# EAGLE design DuressBadge (EAGLE 9.6.2)
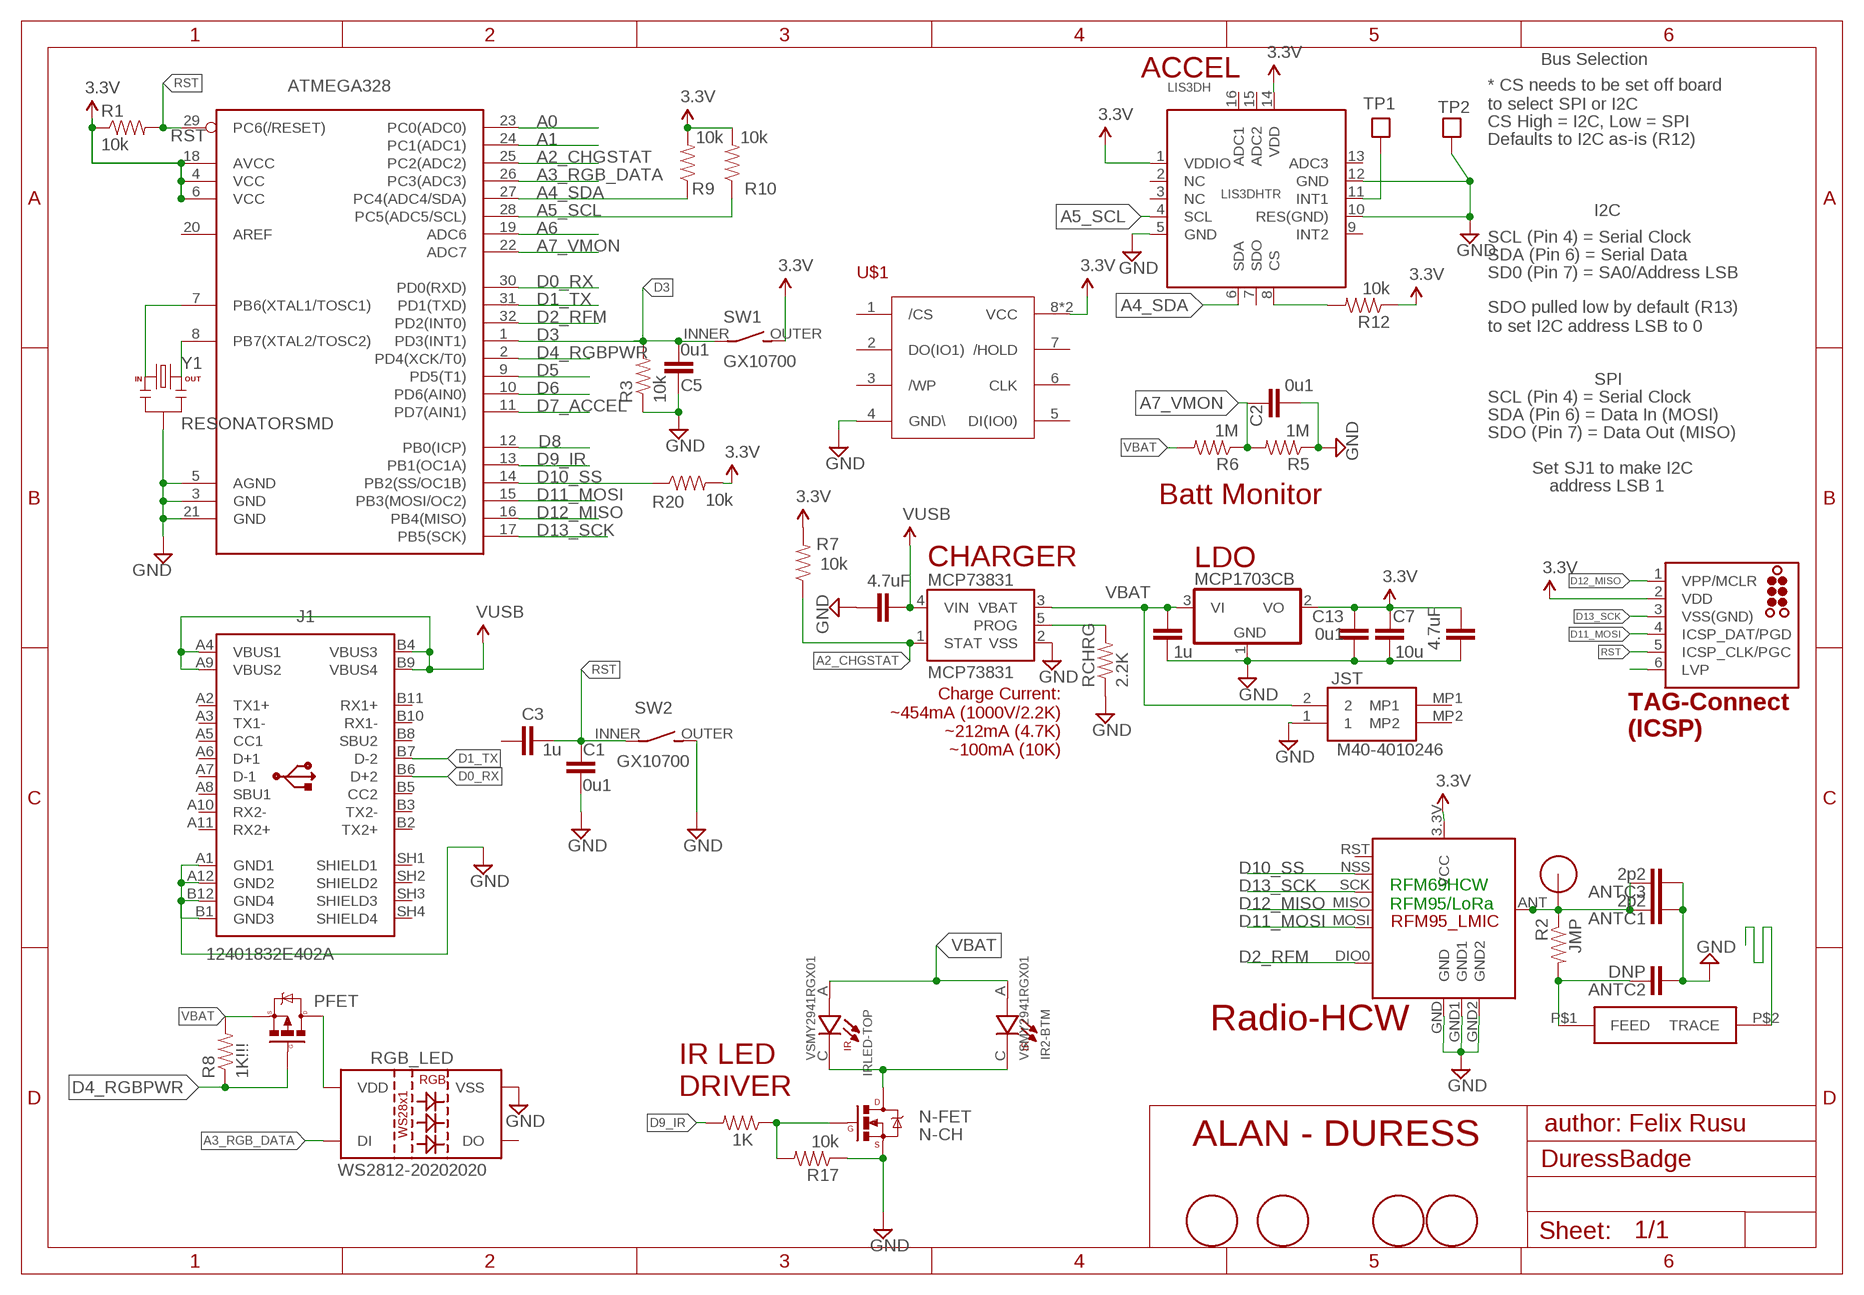
[diagram p0: schematic, sheet 1]

## Parts
ANTC1  2p2  CAP0603-CAP  [0603-CAP]
ANTC2  DNP  CAP0402-CAP  [0402-CAP]
ANTC3  2p2  CAP0402-CAP  [0402-CAP]
ATMEGA328  ATMega-328  ATMEGA168/328TQFP32  [TQFP32-08]
BR_FIDUCIAL  FIDUCIAL1.5MM  [FIDUCIAL_1.5MM]
C1  0u1  CAP0603-CAP  [0603-CAP]
C2  0u1  CAP0603-CAP  [0603-CAP]
C3  1u  CAP0603-CAP  [0603-CAP]
C4  4.7uF  CAP0603-CAP  [0603-CAP]
C5  0u1  CAP0603-CAP  [0603-CAP]
C7  10u  CAP0805-CAP  [0805-CAP]
C8  4.7uF  CAP0603-CAP  [0603-CAP]
C13  0u1  CAP0603-CAP  [0603-CAP]
C14  1u  CAP0603-CAP  [0603-CAP]
FIDUCIAL_BOTTOMRIGHT  FIDUCIALSQ  [FIDUCIAL_1.5MM_SQ]
FIDUCIAL_TOPLEFT  FIDUCIALSQ  [FIDUCIAL_1.5MM_SQ]
IR2-BTM  VSMY2941RGX01  [DIO_VSMY2941RGX01]
IRLED-TOP  VSMY2941RGX01  [DIO_VSMY2941RGX01]
J1  12401832E402A  [12401832E402A]
JST  M40-4010246  [M404010246]
LDO  MCP1703CB  [SOT23]
LIS3DH  LIS3DHTR  ACCEL_LIS3DHTR  [LGA16_3X3MM]
MCP73831  MCP73831  [SOT23-5]
N-FET  N-CH  MOSFET-NCHANNEL  [SOT23-3]
PFET  MOSFET-PCHANNELSMD  [SOT23-3]
R1  10k  RESISTOR0603-RES  [0603-RES]
R2  JMP  RESISTOR0402-RES  [0402-RES]
R3  10k  RESISTOR0603-RES  [0603-RES]
R4  1K  RESISTOR0603-RES  [0603-RES]
R5  1M  RESISTOR0603-RES  [0603-RES]
R6  1M  RESISTOR0603-RES  [0603-RES]
R7  10k  RESISTOR0603-RES  [0603-RES]
R8  1K!!!  RESISTOR0603-RES  [0603-RES]
R9  10k  RESISTOR0603-RES  [0603-RES]
R10  10k  RESISTOR0603-RES  [0603-RES]
R12  10k  RESISTOR0603-RES  [0603-RES]
R17  10k  RESISTOR0603-RES  [0603-RES]
R20  10k  RESISTOR0603-RES  [0603-RES]
RCHRG  2.2K  RESISTOR0603-RES  [0603-RES]
RGB_LED  WS2812-20202020  [WS2812-2020]
SW1  GX10700  [GX10700]
SW2  GX10700  [GX10700]
TAG-ICSP  TAG-Connect  TC2030_ICSP-MCP-NL  [TC2030-MCP-NL]
TL_FIDUCIAL  FIDUCIAL1.5MM  [FIDUCIAL_1.5MM]
TP1  PAD_OR_PIN_1TP  [PAD_1_TESTPOINT]
TP2  PAD_OR_PIN_1TP  [PAD_1_TESTPOINT]
U$1  RFM12B_ANTENNA  [ANTENNA_THRUHOLE]
U$2  W25Q40CLSNIG  [USON]
U$5  JOHANSON0900AT43A0070  [JOHANSON0900AT43A0070]
U$11  RFM95_WITHRST  [RFM95_LONGER_WITHRST]
Y1  RESONATORSMD  [RESONATOR-SMD]

## Nets
A0: ATMEGA328.23(PC0(ADC0))
A1: ATMEGA328.24(PC1(ADC1))
A2_CHGSTAT: ATMEGA328.25(PC2(ADC2)) MCP73831.1(STAT) R7.1
A3_RGB_DATA: ATMEGA328.26(PC3(ADC3)) RGB_LED.3(DI)
A4_SDA: ATMEGA328.27(PC4(ADC4/SDA)) LIS3DH.6(SDA) R9.1
A5_SCL: ATMEGA328.28(PC5(ADC5/SCL)) LIS3DH.4(SCL) R10.1
A6: ATMEGA328.19(ADC6)
A7_VMON: ATMEGA328.22(ADC7) C2.1 R5.2 R6.1
ANT: ANTC1.2 ANTC3.2 R2.1 U$1.P$1 U$11.ANT
D0_RX: ATMEGA328.30(PD0(RXD)) J1.B6(D+2)
D1_TX: ATMEGA328.31(PD1(TXD)) J1.B7(D-2)
D2_RFM: ATMEGA328.32(PD2(INT0)) U$11.DIO0
D3: ATMEGA328.1(PD3(INT1)) C5.2 R3.2 SW1.INNER(P)
D4_RGBPWR: ATMEGA328.2(PD4(XCK/T0)) PFET.1(G) R8.1
D5: ATMEGA328.9(PD5(T1))
D6: ATMEGA328.10(PD6(AIN0))
D7_ACCEL: ATMEGA328.11(PD7(AIN1)) LIS3DH.11(INT1) TP1.TP
D8: ATMEGA328.12(PB0(ICP))
D9_IR: ATMEGA328.13(PB1(OC1A)) R4.2
D10_SS: ATMEGA328.14(PB2(SS/OC1B)) R20.1 U$11.NSS(SEL)
D11_MOSI: ATMEGA328.15(PB3(MOSI/OC2)) TAG-ICSP.4(ICSP_DAT/PGD) U$11.MOSI
D12_MISO: ATMEGA328.16(PB4(MISO)) TAG-ICSP.1(VPP/MCLR) U$11.MISO
D13_SCK: ATMEGA328.17(PB5(SCK)) TAG-ICSP.3(VSS(GND)) U$11.SCK
GND [power]: ANTC1.1 ANTC2.1 ANTC3.1 ATMEGA328.3(GND) ATMEGA328.5(AGND) ATMEGA328.21(GND) C1.1 C2.2 C4.1 C5.1 C7.2 C8.1 C13.2 C14.2 J1.A1(GND1) J1.A12(GND2) J1.B1(GND3) J1.B12(GND4) JST.1 LDO.1(GND) LIS3DH.5(GND) LIS3DH.10(RES(GND)) LIS3DH.12(GND) MCP73831.2(VSS) N-FET.2(S) R3.1 R5.1 R17.1 RCHRG.1 RGB_LED.2(VSS) SW2.OUTER(S) TAG-ICSP.6(LVP) TP2.TP U$2.4(GND\) U$11.GND U$11.GND1 U$11.GND2 Y1.XTAL2_GND
N$1: ATMEGA328.7(PB6(XTAL1/TOSC1)) Y1.XTAL1_IN
N$2: IR2-BTM.C IRLED-TOP.C N-FET.3(D)
N$3: MCP73831.5(PROG) RCHRG.2
N$4: U$5.P$2(TRACE)
N$5: PFET.3(D) RGB_LED.4(VDD)
N$6: N-FET.1(G) R4.1 R17.2
N$10: ANTC2.2 R2.2 U$5.P$1(FEED)
N$11: LIS3DH.8(CS) R12.2
N$21: ATMEGA328.8(PB7(XTAL2/TOSC2)) Y1.XTAL3_OUTPUT(XTAL3_OUT)
RST: ATMEGA328.29(PC6(/RESET)) C1.2 C3.2 R1.2 SW2.INNER(P) TAG-ICSP.5(ICSP_CLK/PGC)
VBAT: C14.1 IR2-BTM.A IRLED-TOP.A JST.2 LDO.3(VI) MCP73831.3(VBAT) PFET.2(S) R6.2 R8.2
VCC: ATMEGA328.4(VCC) ATMEGA328.6(VCC) ATMEGA328.18(AVCC) C4.2 C7.1 C13.1 LDO.2(VO) LIS3DH.1(VDDIO) LIS3DH.14(VDD) R1.1 R7.2 R9.2 R10.2 R12.1 R20.2 SW1.OUTER(S) TAG-ICSP.2(VDD) U$2.8(VCC) U$2.GND1(VCC) U$11.3.3V(VCC) ; supply symbol labelled 3.3V
VUSB: C8.2 J1.A4(VBUS1) J1.A9(VBUS2) J1.B4(VBUS3) J1.B9(VBUS4) MCP73831.4(VIN)
Unconnected: ATMEGA328.20(AREF) BR_FIDUCIAL.P$1(FIDUCIAL) C3.1 FIDUCIAL_BOTTOMRIGHT.P$1(FIDUCIAL) FIDUCIAL_TOPLEFT.P$1(FIDUCIAL) J1.A2(TX1+) J1.A3(TX1-) J1.A5(CC1) J1.A6(D+1) J1.A7(D-1) J1.A8(SBU1) J1.A10(RX2-) J1.A11(RX2+) J1.B2(TX2+) J1.B3(TX2-) J1.B5(CC2) J1.B8(SBU2) J1.B10(RX1-) J1.B11(RX1+) J1.SH1(SHIELD1) J1.SH2(SHIELD2) J1.SH3(SHIELD3) J1.SH4(SHIELD4) JST.MP1 JST.MP2 LIS3DH.2(NC) LIS3DH.3(NC) LIS3DH.7(SDO) LIS3DH.9(INT2) LIS3DH.13(ADC3) LIS3DH.15(ADC2) LIS3DH.16(ADC1) RGB_LED.1(DO) TL_FIDUCIAL.P$1(FIDUCIAL) U$2.1(/CS) U$2.2(DO(IO1)) U$2.3(/WP) U$2.5(DI(IO0)) U$2.6(CLK) U$2.7(/HOLD) U$11.RST

## Notes on the sheet
- ACCEL
- Bus Selection
- * CS needs to be set off board
  to select SPI or I2C
- CS High = I2C, Low = SPI
- Defaults to I2C as-is (R12)
- I2C
- SCL (Pin 4) = Serial Clock
- SDA (Pin 6) = Serial Data
- SD0 (Pin 7) = SA0/Address LSB
- SDO pulled low by default (R13)
  to set I2C address LSB to 0
- SPI
- SCL (Pin 4) = Serial Clock
- SDA (Pin 6) = Data In (MOSI)
- SDO (Pin 7) = Data Out (MISO)
- Set SJ1 to make I2C
- Batt Monitor
- address LSB 1
- CHARGER
- Charge Current:
  ~454mA (1000V/2.2K)
  ~212mA (4.7K)
  ~100mA (10K)
- TAG-Connect
  (ICSP)
- RFM69HCW
  RFM95/LoRa
- Radio-HCW
- IR LED
  DRIVER
- author: Felix Rusu
- ALAN - DURESS

## Library data of the parts
ANTC1-ANTC3 C1-C5 C7 C8 C13 C14 = LowPowerLab:CAP: Capacitor Standard 0603 ceramic capacitor, and 0.1" leaded capacitor.
ATMEGA328 = LowPowerLab:ATMEGA168/328: Atmel 32-pin 8-bit micro, 16k flash.
BR_FIDUCIAL FIDUCIAL_BOTTOMRIGHT FIDUCIAL_TOPLEFT TL_FIDUCIAL = LowPowerLab:FIDUCIAL
IR2-BTM IRLED-TOP = VSMY2941RGX01:VSMY2941RGX01: Infrared Emitters - High Power IR Emtr 940nm; 5ns 160mW/sr; rev-gwing Check availability <https://pricing.snapeda.com/parts/VSMY2941RGX01/Vishay%20Semiconductor/view-part?ref=eda>; AVAILABILITY: In Stock; CHECK_PRICES: https://www.snapeda.com/parts/VSMY2941RGX01/Vishay+Semiconductor+Opto+Division/view-part/?ref=eda; DESCRIPTION: IR Emitter: 940nm, SMD, 160mW/sr, +/-8degrees; MF: Vishay Semiconductor; MP: VSMY2941RGX01; PACKAGE: SMD-2 Vishay Semiconductor; PRICE: None; PURCHASE-URL: https://www.snapeda.com/api/url_track_click_mouser/?unipart_id=3622774&manufacturer=Vishay Semiconductor&part_name=VSMY2941RGX01&search_term=None; SNAPEDA_LINK: https://www.snapeda.com/parts/VSMY2941RGX01/Vishay+Semiconductor+Opto+Division/view-part/?ref=snap
J1 = Connector_USB:12401832E402A: USB(3.1) Type-C- RCPT- 24POS- SMD-THT-R/A Datasheet <https://cdn.amphenol-icc.com/media/wysiwyg/files/documentation/datasheet/inputoutput/io_usb_type_c.pdf> Drawing <https://cdn.amphenol-icc.com/media/wysiwyg/files/drawing/c12401832e402a.pdf>; CATEGORY: USB Connector; CONTACTS: 24; CURRENT_RATING: 5A; DATASHEET: https://cdn.amphenol-cs.com/media/wysiwyg/files/documentation/datasheet/inputoutput/io_usb_3_2_type_c.pdf; DESCRIPTION: USB-C (USB TYPE-C) USB 3.2 Gen 2 (USB 3.1 Gen 2- Superspeed + (USB 3.1)) Receptacle Connector 24 Position Surface Mount- Right Angle- Through Hole; GENDER: Receptacle; MANUFACTURER: Amphenol ICC (Commercial Products); MPN: 12401832E402A; OPERATING_TEMPERATURE: -40℃ ~ 85℃; PACKAGE_SIZE: NA; PACKAGE_TYPE: SMD; PART_STATUS: ACTIVE; ROHS: COMPLIANT; SERIES: NA; SUBCATEGORY: USB TYPE-C; TYPE: Surface Mount-Right Angle-Through Hole; VOLTAGE_RATING: NA
JST = M40-4010246:M40-4010246: Headers & Wire Housings 2P SIL SMT HORIZ SHROUDED TAB HEADER Source: Datasheet <https://componentsearchengine.com/Datasheets/2/M40-4010246.pdf>; DESCRIPTION: Headers & Wire Housings 2P SIL SMT HORIZ SHROUDED TAB HEADER; HEIGHT: 3.15mm; MANUFACTURER_NAME: Harwin; MANUFACTURER_PART_NUMBER: M40-4010246; MOUSER_PART_NUMBER: 855-M40-4010246; MOUSER_PRICE-STOCK: https://www.mouser.co.uk/ProductDetail/Harwin/M40-4010246?qs=%252Bk6%2F5FB6qrkoTdPFThSz5A%3D%3D
LDO = linear:MCP1703: 250 mA, 16V, Low Quiescent Current LDO Regulator Source: http://ww1.microchip.com/downloads/en/DeviceDoc/22049b.pdf
LIS3DH = microbuilder:ACCEL_LIS3DHTR: LIS3DHTR 3-Axis Accelerometer with I2C/SPI Interface VDD: 1.71-3.6V VDDIO: 1.71-VDD+0.1V Scale: +/-2g, 4g, 8g, 16g with 16--bit data output Temp:: -40°C - 85°C Mouser: 511-LIS3DHTR Digikey: 497-10613-1-ND
MCP73831 = SparkFun-PowerIC:MCP73831: Miniature single cell, fully integrated Li-Ion, Li-polymer charge management controller http://ww1.microchip.com/downloads/en/DeviceDoc/20001984g.pdf IC-09995; PROD_ID: IC-09995
N-FET = LowPowerLab:MOSFET-NCHANNEL: Generic PMOSFET
PFET = LowPowerLab:MOSFET-PCHANNEL: Generic PMOSFET
R1-R10 R12 R17 R20 RCHRG = LowPowerLab:RESISTOR: Resistor Basic schematic elements and footprints for 0603, 1206, and PTH resistors.
RGB_LED = LowPowerLab:WS2812-2020
SW1 SW2 = snaptron_Alan:GX10700
TAG-ICSP = tag-connect:TC2030_ICSP: TAG-CONNECT ICSP Connector Manufacturer: Tag-Connect <http://www.tag-connect.com> Cable for easy In-Circuit Serial Programming. Designed for Microchip ICD2, suitable for many others. Two variants - one "with legs" (for hands-free fit on PCB) and another "without legs" for quick programming. PAD Description 1 MCLR/Vpp 2 Vdd 3 GND 4 PGD (ISPDAT) 5 PGC (ISPCLK) 6 nc (used for LVP) ©2009 ROFA.cz - modified and updated by Robert Darlington ‹rdarlington@gmail.com›
TP1 TP2 = LowPowerLab:PAD_OR_PIN_1
U$1 = LowPowerLab:RFM12B_ANTENNA
U$2 = W25Q40CLSNIG:W25Q40CLSNIG: 2.5/3/3.3V 4M-BITSERIAL FLASH MEMORY WITH 4KB SECTORS, DUALAND QUADSPI
U$5 = Kris:JOHANSON0900AT43A0070: Johanson dual wide band antenna http://www.mouser.com/new/Johanson/johanson-0900at43a0070/
U$11 = LowPowerLab:RFM95_WITHRST
Y1 = LowPowerLab:RESONATOR: Resonator Small SMD resonator. This is the itty bitty 10/20MHz resonators with built in caps. CSTCE10M0G55 and CSTCE20M0V53. Footprint has been reviewed closely but hasn't been tested yet.

## Net classes
1 power: width 0.381 mm, clearance 0.254 mm

## Board
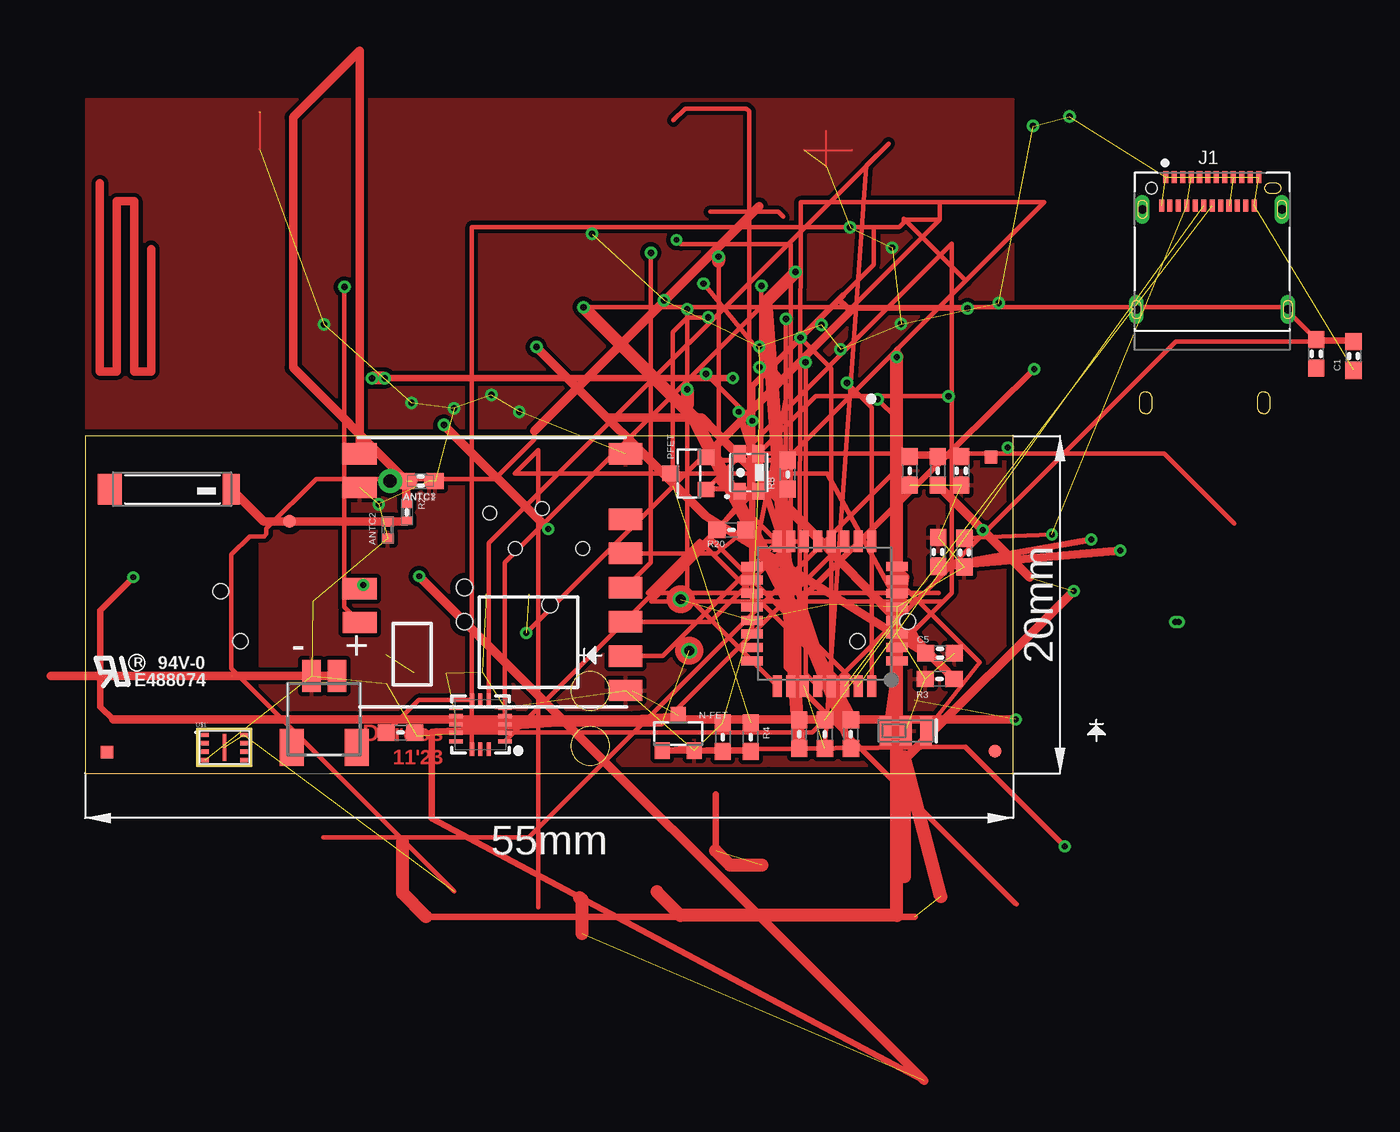
[diagram p1: board, top side]
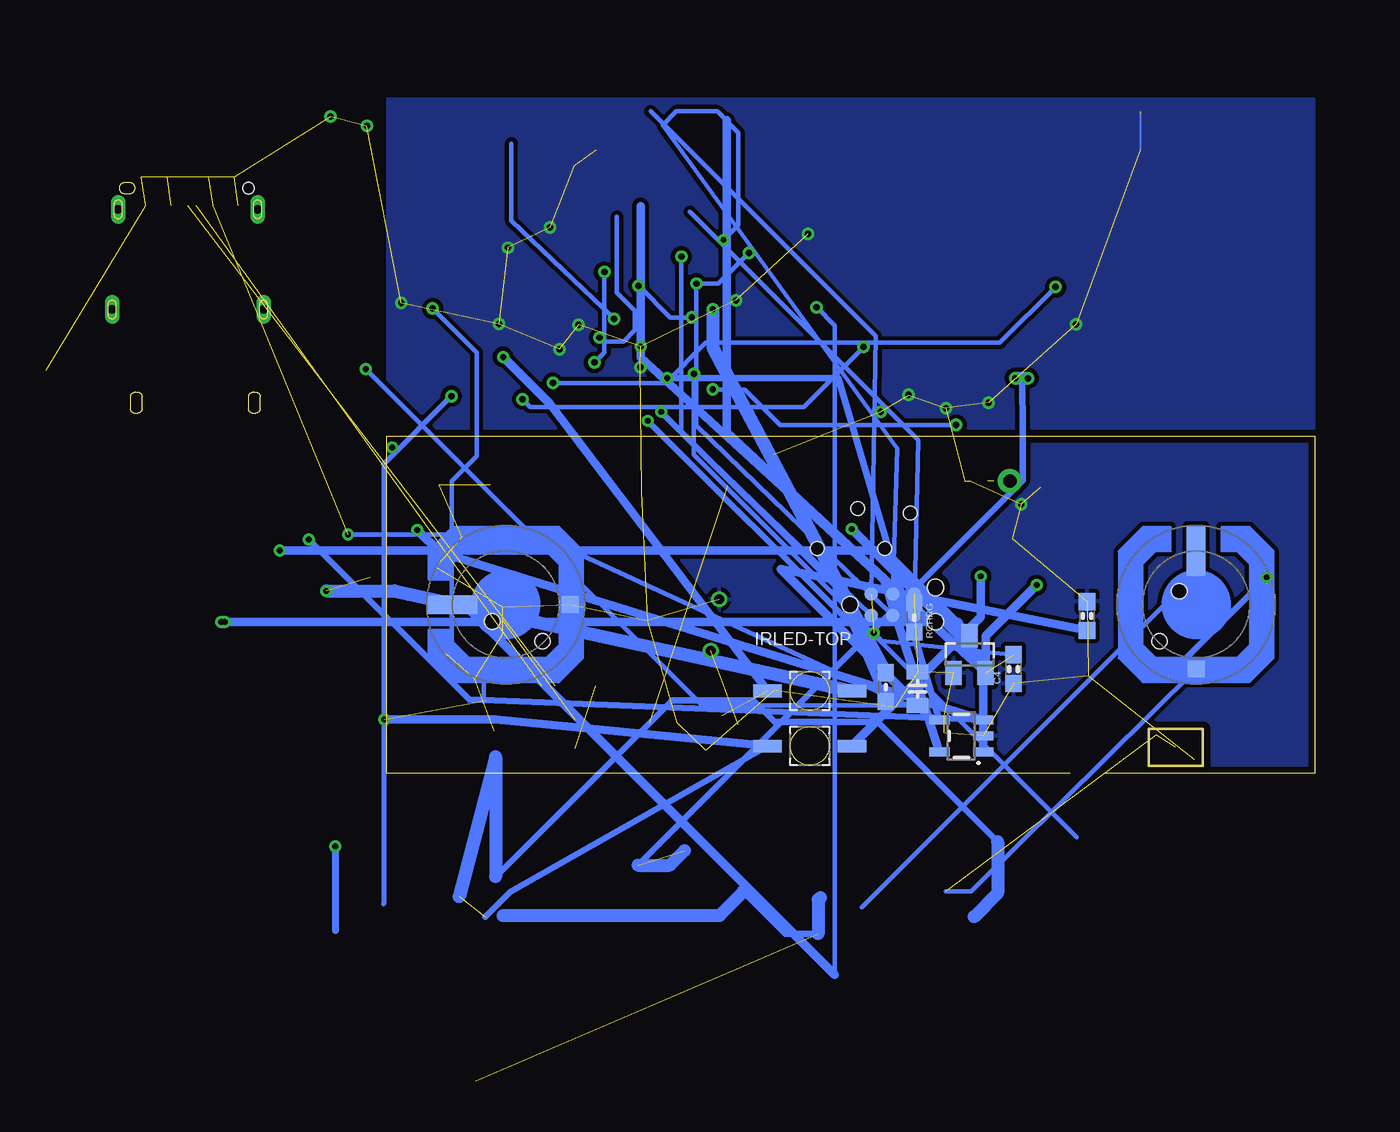
[diagram p2: board, bottom side, seen from below]

Size 70.21 x 22.61 mm. Coordinates in mm from the lower left corner, seen from the top.
Outline: 12.5,0 0,0 0,20 55,20
Outline: 14.5,0 40.5,0
Outline: 40.51,0 55,0 55,20
Outline: 62.51,21.59 62.51,22.35 arc-99 62.91,22.6 62.94,22.6 arc-70 63.2,22.37 63.21,22.35 63.21,21.59 arc-99 62.8,21.34 62.78,21.34 arc-75 62.51,21.59
Outline: 69.51,21.59 69.51,22.35 arc-99 69.91,22.6 69.94,22.6 arc-70 70.2,22.37 70.21,22.35 70.21,21.59 arc-99 69.81,21.34 69.78,21.34 arc-75 69.51,21.59
Copper layers (1*16): Top 0.035mm / dielectric 0.93mm / Bottom 0.035mm
Design rules "default *": minimum track width 6mil, minimum drill 13mil, track to track 8mil, track to pad 8mil, pad to pad 6mil, via to via 6mil, smd to smd 0mil, copper to edge 15mil, drill to drill 6mil, minimum pad ring 7mil, minimum via ring 7mil, stop-mask expansion 4mil, vias tented up to drill 28mil, thermal gap 10mil
Holes 0.8 mm at 23.98,15.43 27.09,15.69 25.5,13.33 29.5,13.33
tRestrict: area 0.1,3.1 to 10.3,20; area 31.6,24 to 32.4,25.7; area 17.3,13.7 to 18.5,14.1

### Footprints (pad centres in the part's own frame; a part is rotated, then mirrored left to right if it is on the bottom)
0603-CAP = smd 1.016 x 0.965: 1 -0.85,0; 2 0.85,0
0402-CAP = smd 0.6 x 0.7: 1 -0.5,0; 2 0.5,0
TQFP32-08 = smd 1.27 x 0.533: 1 -4.293,2.8; 2 -4.293,2; 3 -4.293,1.2; 4 -4.293,0.4; 5 -4.293,-0.4; 6 -4.293,-1.2; 7 -4.293,-2; 8 -4.293,-2.8; 17 4.293,-2.8; 18 4.293,-2; 19 4.293,-1.2; 20 4.293,-0.4; 21 4.293,0.4; 22 4.293,1.2; 23 4.293,2; 24 4.293,2.8 | smd 0.533 x 1.27: 9 -2.8,-4.293; 10 -2,-4.293; 11 -1.2,-4.293; 12 -0.4,-4.293; 13 0.4,-4.293; 14 1.2,-4.293; 15 2,-4.293; 16 2.8,-4.293; 25 2.8,4.293; 26 2,4.293; 27 1.2,4.293; 28 0.4,4.293; 29 -0.4,4.293; 30 -1.2,4.293; 31 -2,4.293; 32 -2.8,4.293
FIDUCIAL_1.5MM = smd 0.762 x 0.762: P$1 0,0
0805-CAP = smd 0.902 x 1.3: 1 -1,0; 2 1,0
FIDUCIAL_1.5MM_SQ = smd 0.762 x 0.762: P$1 0,0
DIO_VSMY2941RGX01 = smd 1.7 x 0.75: A -2.5,0; C 2.5,0
12401832E402A = smd 0.3 x 0.7: A1 -2.75,5; A2 -2.25,5; A3 -1.75,5; A4 -1.25,5; A5 -0.75,5; A6 -0.25,5; A7 0.25,5; A8 0.75,5; A9 1.25,5; A10 1.75,5; A11 2.25,5; A12 2.75,5; B1 2.5,3.3; B2 2,3.3; B3 1.5,3.3; B4 1,3.3; B5 0.5,3.3; B6 0,3.3; B7 -0.5,3.3; B8 -1,3.3; B9 -1.5,3.3; B10 -2,3.3; B11 -2.5,3.3; B12 -3,3.3 | drill 0.5 pad 0.8 long: SH1 -4.13,3.09; SH2 4.13,3.09; SH3 4.49,-2.86; SH4 -4.49,-2.86 | hole 0.65: -3.6,4.34
M404010246 = smd 1.1 x 1.9: 1 -0.754,2.415; 2 0.754,2.415 | smd 1.4 x 2.2: MP1 1.927,-1.841; MP2 -1.927,-1.841
SOT23 = smd 1 x 1.4: 1 -0.95,-1.1; 2 0.95,-1.1; 3 0,1.1
LGA16_3X3MM = smd 0.8 x 0.25: 1 -1.45,1; 2 -1.45,0.5; 3 -1.45,0; 4 -1.45,-0.5; 5 -1.45,-1; 9 1.45,-1; 10 1.45,-0.5; 11 1.45,0; 12 1.45,0.5; 13 1.45,1 | smd 0.25 x 0.8: 6 -0.5,-1.45; 7 0,-1.45; 8 0.5,-1.45; 14 0.5,1.45; 15 0,1.45; 16 -0.5,1.45
SOT23-5 = smd 0.55 x 1.2: 1 -0.95,-1.3; 2 0,-1.3; 3 0.95,-1.3; 4 0.95,1.3; 5 -0.95,1.3
SOT23-3 = smd 0.9 x 1: 1 -0.95,-1; 2 0.95,-1; 3 0,1.1
0603-RES = smd 1.016 x 0.965: 1 -0.85,0; 2 0.85,0
0402-RES = smd 0.508 x 0.66: 1 -0.508,0; 2 0.508,0
WS2812-2020 = smd 1 x 0.7: 1 1.115,-0.55; 2 1.115,0.55; 3 -1.115,0.55; 4 -1.115,-0.55
GX10700 = smd 3 x 1.1: INNER 3.2,0 | smd 1 x 1: OUTER -3.815,0 | hole 0.89: 0.8,1; -2.173,2.173
TC2030-MCP-NL = smd 0.787 x 0.787: 1 1.27,-0.635; 2 1.27,0.635; 3 2.54,-0.635; 4 2.54,0.635; 5 3.81,-0.635; 6 3.81,0.635 | hole 0.94: 0,0; 5.08,-1.016; 5.08,1.016
PAD_1_TESTPOINT = drill 0.584: TP 0,0
ANTENNA_THRUHOLE = drill 0.8 pad 1.422: P$1 0,0
USON = smd 0.45 x 0.25: 1 -1.15,0.75; 2 -1.15,0.25; 3 -1.15,-0.25; 4 -1.15,-0.75; 5 1.15,-0.75; 6 1.15,-0.25; 7 1.15,0.25; 8 1.15,0.75 | smd 0.2 x 1.6: GND1 0,0
JOHANSON0900AT43A0070 = smd 1 x 1.8: P$1 -3.5,0 | smd 1.4 x 1.8: P$2 3.7,0
RFM95_LONGER_WITHRST = smd 2 x 1.27: 3.3V 7.651,1; ANT 7.651,-7; DIO0 7.651,3; GND 7.651,-5; GND1 -8.107,-7; GND2 -8.107,7.032; MISO -8.107,5; MOSI -8.107,2.968; NSS -8.107,-1.096; RST -8.107,-3.128; SCK -8.107,0.936
RESONATOR-SMD = smd 0.7 x 1.7: XTAL1_IN -1.2,0; XTAL2_GND 0,0; XTAL3_OUTPUT 1.2,0

### Placement (x,y rotation side)
ANTC1  19.89,17.32 180 top
ANTC2  17.93,14.43 90 top
ANTC3  19.89,17.32 180 top
ATMEGA328  43.83,9.45 180 top
BR_FIDUCIAL  53.93,1.29 0 top
C1  75.18,24.74 90 top  (outside the outline)
C2  51.93,17.93 270 top
C3  72.97,24.87 90 top
C4  17.86,6.17 90 bottom
C5  50.67,7.11 180 top
C7  23.55,5.01 90 bottom
C8  52.12,13.08 90 top
C13  13.5,9.32 90 bottom
C14  50.56,13.12 90 top
FIDUCIAL_BOTTOMRIGHT  53.7,18.75 0 top
FIDUCIAL_TOPLEFT  1.3,1.24 0 top
IR2-BTM  29.94,1.61 0 bottom
IRLED-TOP  29.94,4.88 180 bottom
J1  66.8,30.35 0 top  (outside the outline)
JST  14.17,3.36 0 top
LDO  20.47,7.04 0 bottom
LIS3DH  23.42,2.89 180 top
MCP73831  20.95,2.21 90 bottom
N-FET  35.15,2.34 0 top
PFET  35.8,17.78 90 top
R1  45.39,2.31 90 top
R2  19.05,15.47 270 top
R3  50.65,5.59 0 top
R4  39.45,2.13 90 top
R5  48.88,17.93 90 top
R6  50.53,17.93 270 top
R7  25.44,5.11 270 bottom
R8  41.64,17.7 90 top
R9  43.85,2.31 90 top
R10  42.33,2.31 90 top
R12  18.69,2.4 180 top
R17  37.8,2.13 270 top
R20  38.3,14.43 180 top
RCHRG  23.75,9.22 270 bottom
RGB_LED  39.34,17.83 270 top
SW1  7.04,9.99 90 bottom
SW2  47.96,9.99 180 bottom
TAG-ICSP  27.56,9.99 0 bottom
TL_FIDUCIAL  12.11,14.94 0 top
TP1  35.81,7.26 0 top
TP2  35.31,10.31 0 top
U$1  18.07,17.32 90 top
U$2  8.26,1.52 0 top
U$5  5.16,16.84 180 top
U$11  23.93,11.94 180 top
U$31  [LOGO_UL_XSMALL_PCBWAY]  0.56,5.1 0 top
Y1  48.64,2.52 180 top

### Tracks (layer width: path | path; a pad name or v marks a point on that pad's centre or on a via)
A2_CHGSTAT  (via drill 0.35, 0.38)
  Top 0.254: ATMEGA328.25 35.69,10.51 35.69,21.8 v35.69,27.51
  Top 0.508: v21.26,20.65 v27.44,14.47
  Top 0.762: v35.69,22.76 35.69,21.8
  Bottom 0.254: v21.26,20.65 31.67,20.65 33.78,22.76 v35.69,22.76
  Bottom 0.508: v27.44,14.47 19.65,6.67 MCP73831.1
  Bottom 0.762: v35.69,27.51 35.69,25.25 R7.1
A3_RGB_DATA  (via drill 0.38)  (1 unrouted)
  Top 0.254: v51.18,22.35 43.3,22.35 RGB_LED.3
  Top 0.305: 55.19,-7.77 42.26,5.16 ATMEGA328.26
  Bottom 0.305: v51.18,22.35 55.19,18.34 55.19,-7.77
A4_SDA  (via drill 0.38)  (1 unrouted)
  Top 0.254: v41.53,26.95 41.53,6.26 ATMEGA328.27 | LIS3DH.6 23.93,13.64 47.62,37.34 46.31,36.02 R9.1
  Bottom 0.254: v41.53,26.95 47.62,32.77 47.62,37.34
A5_SCL  (via drill 0.38)
  Top 0.254: v42.7,24.36 42.7,5.9 ATMEGA328.28 | v42.11,29.72 24.88,12.48 LIS3DH.4
  Top 0.762: v42.11,29.72 40.33,27.93 R10.1
  Bottom 0.254: v42.11,29.72 42.11,24.94 v42.7,24.36
A7_VMON  (via drill 0.38)  (1 unrouted)
  Top 0.254: C2.1 R5.2 | R5.2 R6.1 | R5.2 26.29,-3.81 14.1,-3.81 | v36.8,23.67 39.54,20.94 ATMEGA328.22
  Bottom 0.254: v36.8,23.67 36.8,18.9 14.1,-3.81
ANT  (1 unrouted)
  Top 0.508: ANTC1.2 19.04,16.39 R2.1 | U$11.ANT 16.28,42.84 12.32,38.89 12.32,24.04 ANTC1.2 | ANTC1.2 U$1.P$1
D0_RX  (1 unrouted)
  Top 0.254: 50.61,10.69 33.35,10.69 36.42,13.77 ATMEGA328.30
D1_TX  (1 unrouted)
  Top 0.254: 50.75,10.19 33.55,10.19 37.18,13.81 ATMEGA328.31
D2_RFM  (via drill 0.38)
  Top 0.254: v15.37,28.83 15.37,9.85 U$11.DIO0 | v45.16,23.14 46.63,21.67 ATMEGA328.32
  Bottom 0.254: v45.16,23.14 38.48,23.14 36.09,25.53 18.67,25.53 v15.37,28.83
D3  (via drill 0.38)  (1 unrouted)
  Top 0.254: 26.85,-7.95 26.85,19.16 25.45,17.75 43.97,17.75 C5.2 | v46.97,22.17 48.12,21.02 ATMEGA328.1
  Top 0.508: R3.2 36.53,21.09 30.93,21.09 v26.75,25.27 36.77,15.24 C5.2
  Bottom 0.254: 26.85,-7.95 7.48,11.43 SW1.INNER | v26.75,25.27 30.3,21.72 46.51,21.72 v46.97,22.17
D4_RGBPWR
  Top 0.254: PFET.1 51.36,31.39 51.36,10.69 ATMEGA328.2
  Top 0.305: PFET.1 36.82,16.85 R8.1
D7_ACCEL  (1 unrouted)
  Top 0.254: ATMEGA328.11 34.17,2.89 LIS3DH.11
D9_IR  (via drill 0.38)  (1 unrouted)
  Top 0.254: v40.08,28.91 40.08,17.1 ATMEGA328.13 | 34.82,17.03 34.82,26.16 35.69,27.03 v36.93,27.03
  Bottom 0.254: v36.93,27.03 38.2,27.03 v40.08,28.91
D10_SS
  Top 0.254: U$11.NSS 37.4,13.03 R20.1 38.94,13.75 ATMEGA328.14
D11_MOSI  (via drill 0.35)
  Top 0.254: U$11.MOSI 37.05,8.97 ATMEGA328.15 41.83,31.37 35.31,31.37 v35.05,31.62
  Bottom 0.254: v35.05,31.62 34.16,32.51 34.16,37.97 35.43,39.24 37.84,39.24 38.65,38.44 24.77,19.25 TAG-ICSP.4
D12_MISO  (via drill 0.38)
  Top 0.254: U$11.MISO 34.22,6.94 ATMEGA328.16 37.54,17.24 37.54,30.35
  Top 0.762: v37.54,30.63 37.54,30.35
  Bottom 0.254: v37.54,30.63 37.54,20.23 TAG-ICSP.1
D13_SCK  (via drill 0.38)
  Top 0.254: ATMEGA328.17 41.68,22.9 v36.65,29.03 | v33.53,30.86 33.53,12.5 U$11.SCK
  Bottom 0.254: v33.53,30.86 35.36,29.03 v36.65,29.03 36.65,20.61 TAG-ICSP.3
GND  (via drill 0.38)  (59 unrouted)
  Top 0.127: 10.34,39.22 10.34,37.03 | 42.62,36.96 45.47,36.96 | 43.92,35.99 43.92,38.08
  Bottom 0.127: 10.34,39.17 10.34,36.98
  other vias: 34.32,28.04 39.95,25.3 39.98,24.08 43.64,26.59 25.73,21.44 24.08,22.43 30.05,31.98 14.15,26.62 58.34,38.94 56.18,38.38 54.15,27.89 44.78,25.15 47.83,31.17 21.87,21.64 19.33,21.97 48.36,26.64 45.34,32.36 17.4,15.95
  pour Bottom: 0.02,0 55.02,0 54.98,40 0.02,40
  pour Top: 0.05,0 55,0 55.01,39.97 0.05,39.97
N$1
  Top 0.254: ATMEGA328.7 53.02,6.55 Y1.XTAL1_IN
N$2  (via drill 0.35)  (2 unrouted)
  Top 0.381: N-FET.3 20.55,2.44 20.55,-2.69 29.31,-7.37 49.72,-18.25
  Top 0.508: 49.72,-18.25 v19.79,11.68
  Top 0.762: 29.31,-7.37 29.44,-7.49 29.44,-9.53 | 33.88,-7.04 35.28,-8.43 48.11,-8.43 v48.11,24.68
  Bottom 0.381: 29.44,-9.53 31.39,-9.53 33.88,-7.04
  Bottom 0.508: v19.79,11.68 19.79,9.26 IR2-BTM.C | v48.11,24.68 45.34,21.91 IRLED-TOP.C
  Bottom 0.762: 29.44,-9.53 29.44,-7.49 29.31,-7.37 | 48.11,-8.43 35.28,-8.43 33.88,-7.04
N$3  (via drill 0.35)
  Bottom 0.508: MCP73831.5 25.55,11.53 RCHRG.2
  other vias: 54.69,19.3
N$5
  Top 0.254: PFET.3 34.7,17.22 | RGB_LED.4 63.96,18.94 68.1,14.81
N$6  (via drill 0.35)
  Top 0.254: R4.1 R17.2 34.26,1.28 N-FET.1 35.88,1.56
  Top 0.305: v58.06,-4.34 52.17,1.55 N-FET.1
  Bottom 0.406: v58.06,-4.34 58.06,-9.35
N$7
  Top 0.508: 0.86,34.98 0.86,23.82 1.88,23.82
N$8
  Top 0.508: 1.88,23.82 1.88,33.91 2.9,33.91 2.9,23.82 3.91,23.82 3.91,31.09
N$10
  Top 0.508: U$5.P$1 10.57,14.93 ANTC2.2 19.05,14.94 R2.2
N$11
  Top 0.254: LIS3DH.8 19.78,4.34 R12.2
N$21
  Top 0.254: ATMEGA328.8 48.73,11.65 Y1.XTAL3_OUTPUT
RST  (via drill 0.38)  (2 unrouted)
  Top 0.254: v42.39,25.83 44.23,23.99 ATMEGA328.29 64.66,25.59 C1.2 75.06,25.72 C3.2 71.06,27.64 v29.53,27.64 | 37.05,33.3 41.07,33.3 41.37,32.99
  Top 0.762: v29.53,27.64 36.1,21.06 R1.2
  Bottom 0.254: v42.39,25.83 42.16,25.6 40.97,25.6 40.31,26.26 40.31,27.43 41.38,28.5 41.38,32.99 41.37,32.99 | v29.53,27.64 28.45,26.56 28.45,-11.97 | 37.05,33.3 23.5,19.74 TAG-ICSP.5
  Bottom 0.508: 28.45,-11.97 50.54,10.12 SW2.INNER
VBAT  (via drill 0.35, 0.38)  (6 unrouted)
  Top 0.305: v52.3,27.56 45.63,27.56 PFET.2 36.98,18.55 R8.2
  Top 0.381: JST.2 8.7,5.78 | v2.85,11.62 0.89,9.65 0.89,3.94 1.65,3.17 | 20.19,-8.51 49.16,-8.51 | C14.1 v59.62,13.87
  Top 0.508: 1.65,3.17 v55.15,3.17 | v58.6,10.81 48.59,0.81 48.56,-6.15 | v61.35,13.22 C14.1 | JST.2 -2.04,5.78 | R6.2 v53.19,14.42 55.99,11.62
  Top 0.762: 20.19,-8.51 18.8,-7.11 18.8,-4.06 | 50.72,-7.32 48.56,0.96 48.56,-6.15
  Bottom 0.254: 49.15,4.32 49.28,4.45 49.28,5.87 51.16,7.75 51.16,17.32 49.68,18.8 49.68,24.94 v52.3,27.56
  Bottom 0.381: 8.7,5.78 v2.85,11.62 | IR2-BTM.A 47.7,-7.04 49.16,-8.51 | 18.8,-4.06 25.91,3.05 32,3.05 33.27,4.32 38.1,4.32 48.56,-6.15 | MCP73831.3 50.12,4.37 v59.62,13.87
  Bottom 0.508: v55.15,3.17 48.59,3.17 IR2-BTM.A | LDO.3 25.54,13.22 v61.35,13.22 | v53.19,14.42 51.85,13.07 MCP73831.3
  Bottom 0.762: 20.19,-8.51 18.8,-7.11 18.8,-4.06 | v58.6,10.81 54.54,10.81 IRLED-TOP.A | 50.72,-7.32 48.56,0.96 48.56,-6.15
VCC  (via drill 0.35)  (8 unrouted)
  Top 0.254: R12.1 43.09,2.4 R9.2 42.52,3.29 R10.2 42.41,33.86 56.85,33.86 LIS3DH.1 52.2,29.21 48.59,32.82 | 46.74,32.38 22.93,32.38 LIS3DH.14 | 46.74,32.38 48.26,32.38 48.51,32.64 48.51,32.89 48.59,32.82 | 46.74,32.38 46.74,30.15 44.91,28.32 44.68,28.09 | 26.62,20.3 26.62,19.79 24.28,17.45 13.69,17.45 10.74,14.5 10.74,14.17 10.62,14.05 9.75,14.05 8.66,12.95 8.66,6.21 21.88,-7.01 | 50.65,32.82 48.59,32.82 | 50.66,33.77 50.66,32.83 50.65,32.82 | 50.65,32.82 v26.14,8.31 | 34.87,38.72 35.56,39.42 39.2,39.42 39.37,39.24 39.37,16.7 R20.2 | 48.12,25.11 ATMEGA328.6
  Top 0.381: 48.12,25.11 ATMEGA328.4 | 44.68,28.09 45.14,27.64 | v56.26,23.95 41.95,9.83 R1.1 v38.73,21.43 | 44.91,28.32 39.54,22.95 v39.54,20.9 ATMEGA328.18
  Top 0.508: v64.81,8.98 v64.61,8.98 | 39.96,33.63 26.62,20.3 | U$11.3.3V v16.49,11.15
  Bottom 0.254: 21.88,-7.01 20.36,-7.01 SW1.OUTER | C7.1 36.32,4.01 v56.26,23.95 | v26.14,8.31 25.66,7.83 C4.2 | 39.37,39.24 26.04,25.91 TAG-ICSP.2
  Bottom 0.381: v38.73,21.43 28.38,11.08 R7.2 27.31,8.67 v39.54,20.9
  Bottom 0.508: LDO.2 21.13,8.98 v64.61,8.98 | LDO.2 39.96,24.66 39.96,33.63 | LDO.2 19.52,8.12 v16.49,11.15 | 34.87,38.72 34.87,20.24 LDO.2 | C13.1 31.65,12.11 C7.1
VUSB  (via drill 0.35, 0.38)  (5 unrouted)
  Top 0.254: C8.2 v57.31,14.15
  Top 0.381: v17.75,23.42 v38.38,23.42 | 37.36,-4.6 37.36,-1.25
  Top 0.762: v17.75,23.42 v16.99,23.42 | 40.13,-5.46 38.23,-5.46 37.36,-4.6
  Bottom 0.254: MCP73831.4 46.12,14.15 v57.31,14.15
  Bottom 0.381: MCP73831.4 28.26,23.42 v38.38,23.42 | v16.99,23.42 17.35,23.24 17.32,20.42 17.32,17.35 40.13,-5.46
  Bottom 0.762: v17.75,23.42 v16.99,23.42 | 37.36,-4.6 38.23,-5.46 40.13,-5.46

### Text on the board
Top: Duress | 11'23
tPlace: - | +
tStop: Duress